# EAGLE schematic Schematic (EAGLE 9.7.0)
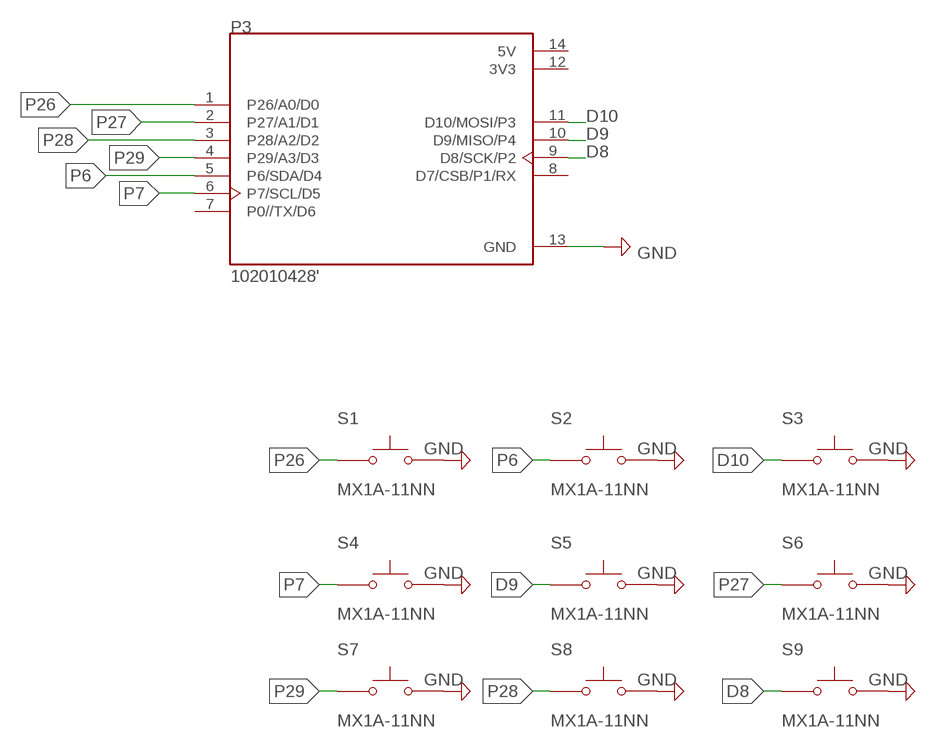
[diagram p0: schematic, sheet 1]

## Parts
P3  102010428'  [MODULE_102010428]
S1  MX1A-11NN  [SW_MX1A-11NN]
S2  MX1A-11NN  [SW_MX1A-11NN]
S3  MX1A-11NN  [SW_MX1A-11NN]
S4  MX1A-11NN  [SW_MX1A-11NN]
S5  MX1A-11NN  [SW_MX1A-11NN]
S6  MX1A-11NN  [SW_MX1A-11NN]
S7  MX1A-11NN  [SW_MX1A-11NN]
S8  MX1A-11NN  [SW_MX1A-11NN]
S9  MX1A-11NN  [SW_MX1A-11NN]

## Nets
D8: P3.9(D8/SCK/P2) S9.1
D9: P3.10(D9/MISO/P4) S5.1
D10: P3.11(D10/MOSI/P3) S3.1
GND: P3.13(GND) S1.2 S2.2 S3.2 S4.2 S5.2 S6.2 S7.2 S8.2 S9.2
P6: P3.5(P6/SDA/D4) S2.1
P7: P3.6(P7/SCL/D5) S4.1
P26: P3.1(P26/A0/D0) S1.1
P27: P3.2(P27/A1/D1) S6.1
P28: P3.3(P28/A2/D2) S8.1
P29: P3.4(P29/A3/D3) S7.1
Unconnected: P3.7(P0//TX/D6) P3.8(D7/CSB/P1/RX)

## Power pins joined to a net without a drawn wire
3V3: P3.12(3V3)
5V: P3.14(5V)

## Library data of the parts
P3 = RP2040_Schematic:102010428: Check availability <https://pricing.snapeda.com/parts/102010428/Seeed%20Technology%20Co.%2C%20Ltd/view-part?ref=eda>
S1-S9 = MX1A-11NN:MX1A-11NN: Check availability <https://pricing.snapeda.com/parts/MX1A11NN/Cherry/view-part?ref=eda>